# Altium project Stepper-Driver-v2.0.PrjPcb (part 3 of 5)

## Sheet Stepper-Driver-Sheet.SchDoc
size 420 x 297 mm; SheetNumber: 7; SheetTotal: 7
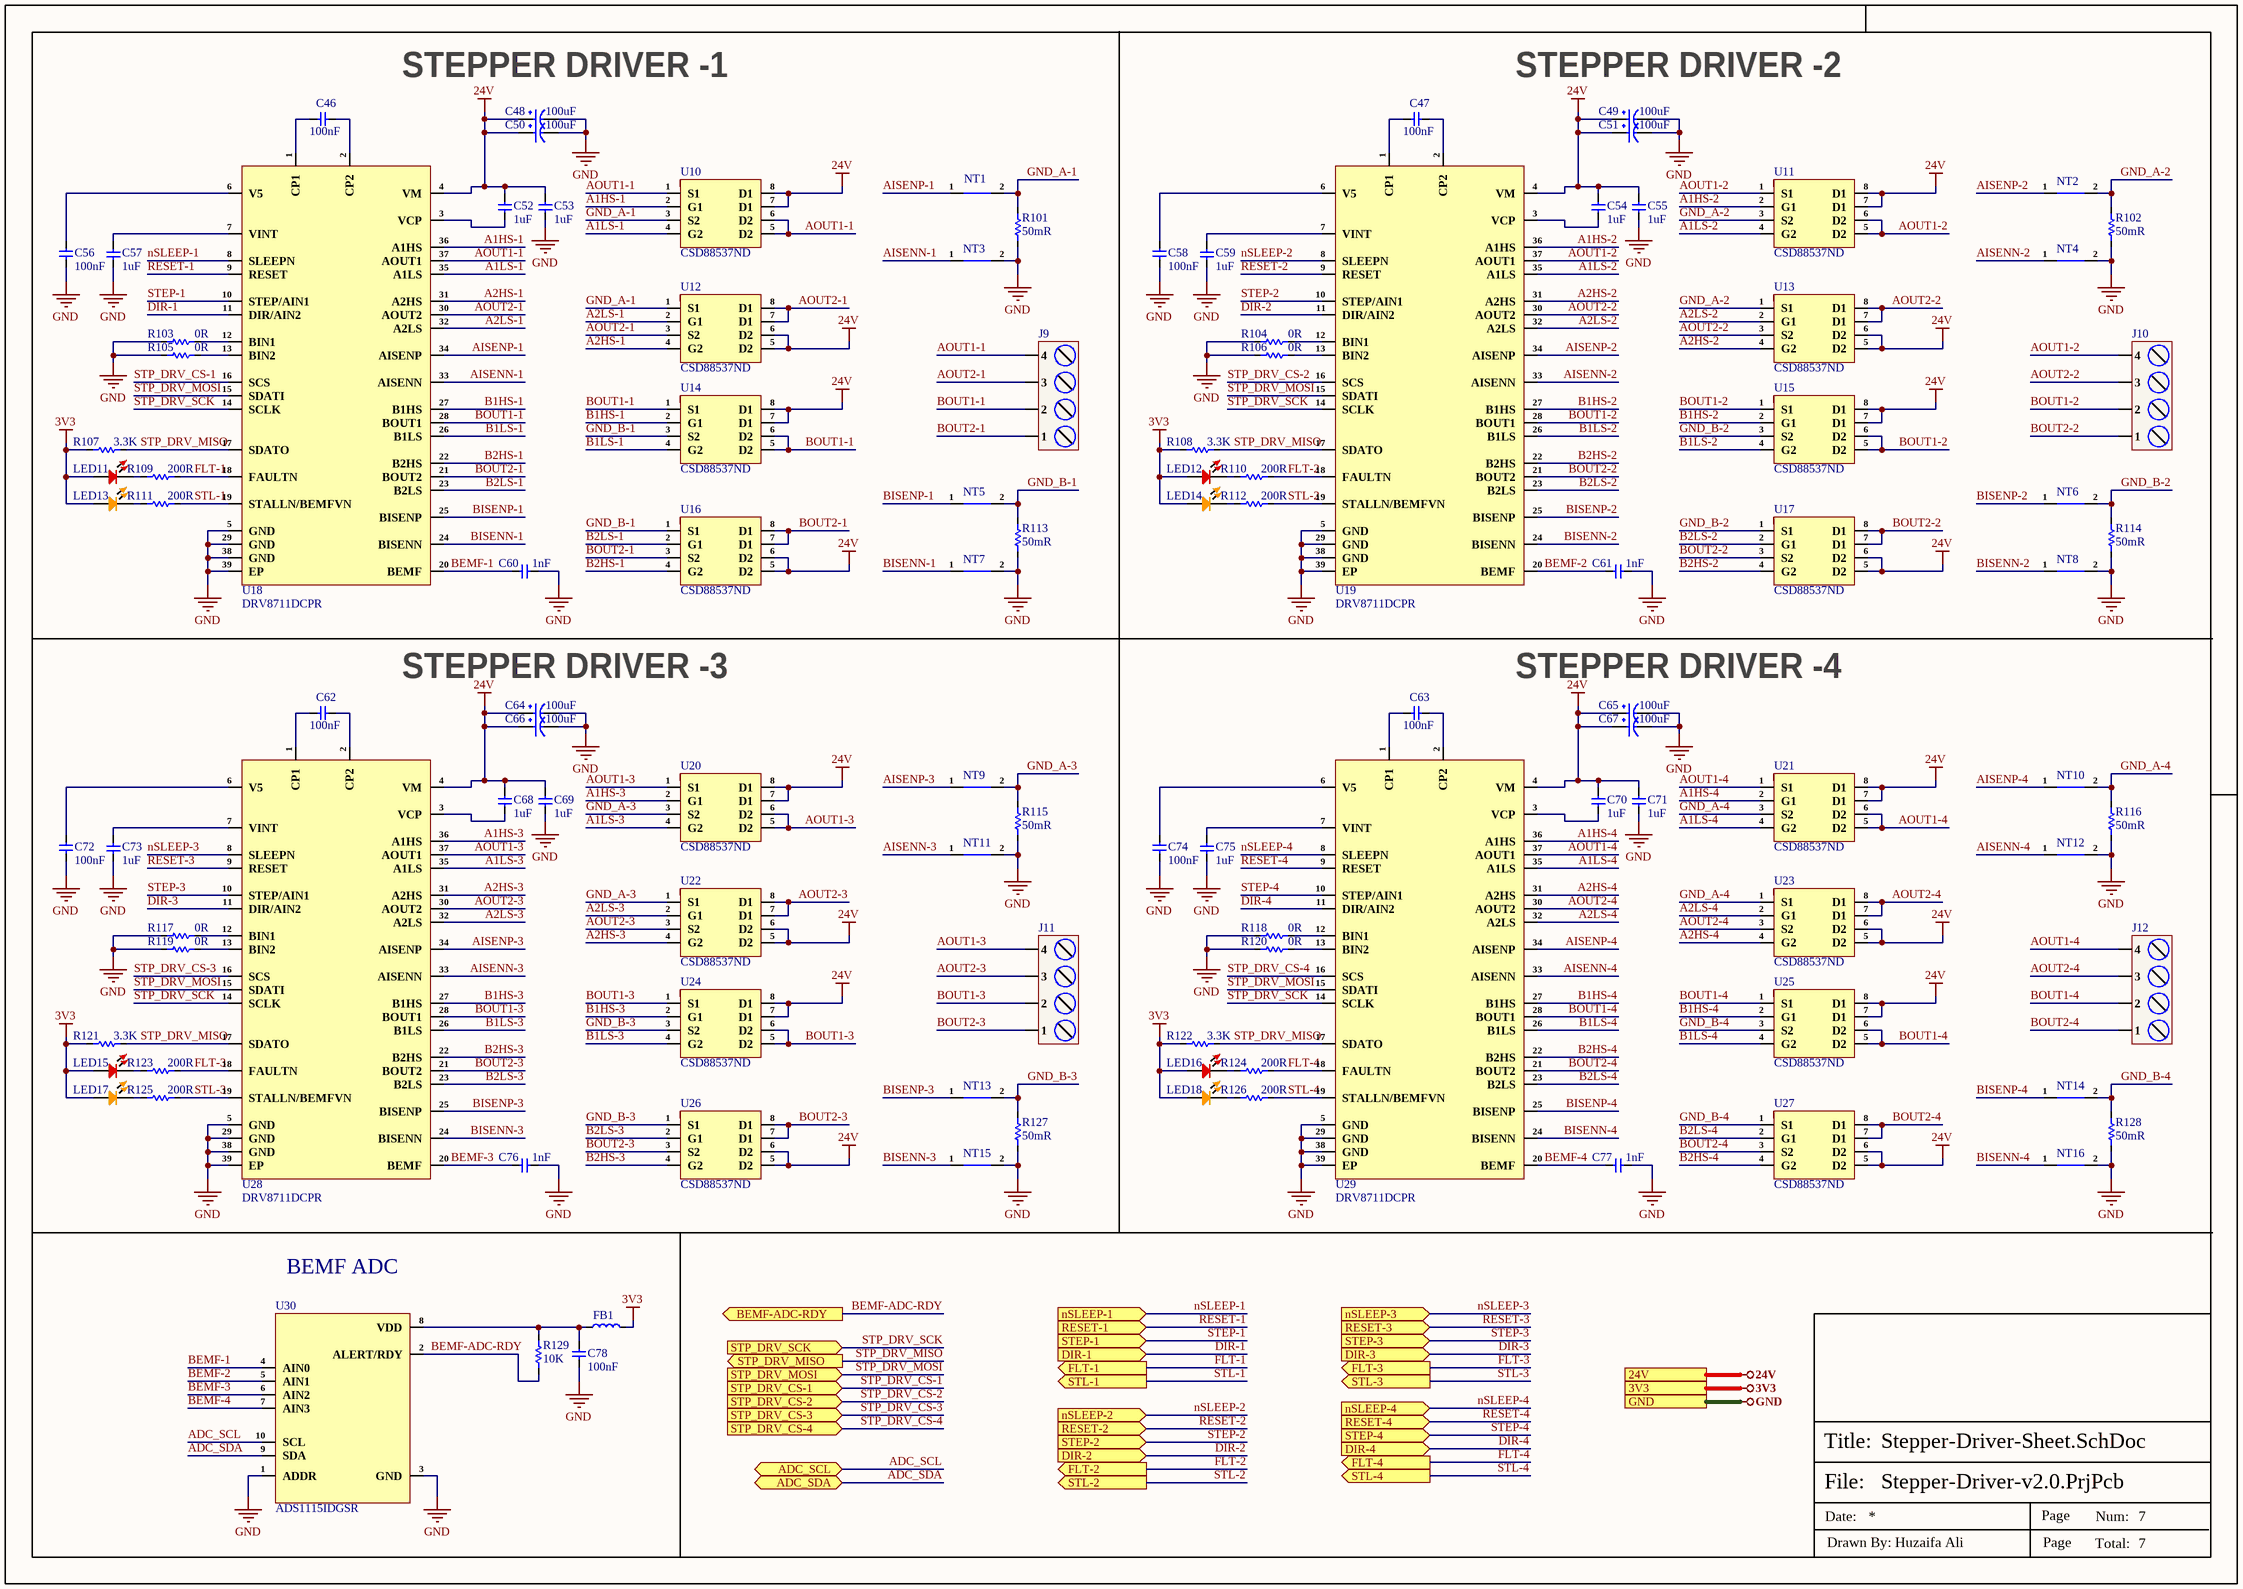
[diagram p4: Stepper-Driver-Sheet.SchDoc]

### Parts
C46  100nF  [cap-0402]
C47  100nF  [cap-0402]
C48  100uF  [SVZ1VM101E09E00RAXXX]
C49  100uF  [SVZ1VM101E09E00RAXXX]
C50  100uF  [SVZ1VM101E09E00RAXXX]
C51  100uF  [SVZ1VM101E09E00RAXXX]
C52  1uF  [Cap-0603]
C53  1uF  [Cap-0603]
C54  1uF  [Cap-0603]
C55  1uF  [Cap-0603]
C56  100nF  [cap-0402]
C57  1uF  [Cap-0603]
C58  100nF  [cap-0402]
C59  1uF  [Cap-0603]
C60  1nF  [Cap-0402]
C61  1nF  [Cap-0402]
C62  100nF  [cap-0402]
C63  100nF  [cap-0402]
C64  100uF  [SVZ1VM101E09E00RAXXX]
C65  100uF  [SVZ1VM101E09E00RAXXX]
C66  100uF  [SVZ1VM101E09E00RAXXX]
C67  100uF  [SVZ1VM101E09E00RAXXX]
C68  1uF  [Cap-0603]
C69  1uF  [Cap-0603]
C70  1uF  [Cap-0603]
C71  1uF  [Cap-0603]
C72  100nF  [cap-0402]
C73  1uF  [Cap-0603]
C74  100nF  [cap-0402]
C75  1uF  [Cap-0603]
C76  1nF  [Cap-0402]
C77  1nF  [Cap-0402]
C78  100nF  [cap-0402]
FB1  BLM18PG221SN1D  [IND-0603 (1608 Metric)]  (value not drawn)
J9  DB128L-5.08-4P-GN-S  [DB128L-5.08-4P-GN-S]  (value not drawn)
J10  DB128L-5.08-4P-GN-S  [DB128L-5.08-4P-GN-S]  (value not drawn)
J11  DB128L-5.08-4P-GN-S  [DB128L-5.08-4P-GN-S]  (value not drawn)
J12  DB128L-5.08-4P-GN-S  [DB128L-5.08-4P-GN-S]  (value not drawn)
LED11  RED  [LED-0603]  (value not drawn)
LED12  RED  [LED-0603]  (value not drawn)
LED13  NCD0603O2  [LED-0603]  (value not drawn)
LED14  NCD0603O2  [LED-0603]  (value not drawn)
LED15  RED  [LED-0603]  (value not drawn)
LED16  RED  [LED-0603]  (value not drawn)
LED17  NCD0603O2  [LED-0603]  (value not drawn)
LED18  NCD0603O2  [LED-0603]  (value not drawn)
NT1  Net Tie_SMD  [Net Tie Pad]  (value not drawn)  (net tie, no BOM)
NT2  Net Tie_SMD  [Net Tie Pad]  (value not drawn)  (net tie, no BOM)
NT3  Net Tie_SMD  [Net Tie Pad]  (value not drawn)  (net tie, no BOM)
NT4  Net Tie_SMD  [Net Tie Pad]  (value not drawn)  (net tie, no BOM)
NT5  Net Tie_SMD  [Net Tie Pad]  (value not drawn)  (net tie, no BOM)
NT6  Net Tie_SMD  [Net Tie Pad]  (value not drawn)  (net tie, no BOM)
NT7  Net Tie_SMD  [Net Tie Pad]  (value not drawn)  (net tie, no BOM)
NT8  Net Tie_SMD  [Net Tie Pad]  (value not drawn)  (net tie, no BOM)
NT9  Net Tie_SMD  [Net Tie Pad]  (value not drawn)  (net tie, no BOM)
NT10  Net Tie_SMD  [Net Tie Pad]  (value not drawn)  (net tie, no BOM)
NT11  Net Tie_SMD  [Net Tie Pad]  (value not drawn)  (net tie, no BOM)
NT12  Net Tie_SMD  [Net Tie Pad]  (value not drawn)  (net tie, no BOM)
NT13  Net Tie_SMD  [Net Tie Pad]  (value not drawn)  (net tie, no BOM)
NT14  Net Tie_SMD  [Net Tie Pad]  (value not drawn)  (net tie, no BOM)
NT15  Net Tie_SMD  [Net Tie Pad]  (value not drawn)  (net tie, no BOM)
NT16  Net Tie_SMD  [Net Tie Pad]  (value not drawn)  (net tie, no BOM)
R101  50mR  [RES-2010]
R102  50mR  [RES-2010]
R103  0R  [Res-0402]
R104  0R  [Res-0402]
R105  0R  [Res-0402]
R106  0R  [Res-0402]
R107  3.3K  [Res-0402]
R108  3.3K  [Res-0402]
R109  200R  [Res-0402]
R110  200R  [Res-0402]
R111  200R  [Res-0402]
R112  200R  [Res-0402]
R113  50mR  [RES-2010]
R114  50mR  [RES-2010]
R115  50mR  [RES-2010]
R116  50mR  [RES-2010]
R117  0R  [Res-0402]
R118  0R  [Res-0402]
R119  0R  [Res-0402]
R120  0R  [Res-0402]
R121  3.3K  [Res-0402]
R122  3.3K  [Res-0402]
R123  200R  [Res-0402]
R124  200R  [Res-0402]
R125  200R  [Res-0402]
R126  200R  [Res-0402]
R127  50mR  [RES-2010]
R128  50mR  [RES-2010]
R129  10K  [Res-0402]
U10  CSD88537ND  [SOIC-8]
U11  CSD88537ND  [SOIC-8]
U12  CSD88537ND  [SOIC-8]
U13  CSD88537ND  [SOIC-8]
U14  CSD88537ND  [SOIC-8]
U15  CSD88537ND  [SOIC-8]
U16  CSD88537ND  [SOIC-8]
U17  CSD88537ND  [SOIC-8]
U18  DRV8711DCPR  [HTSSOP-38-EP-4.4mm]
U19  DRV8711DCPR  [HTSSOP-38-EP-4.4mm]
U20  CSD88537ND  [SOIC-8]
U21  CSD88537ND  [SOIC-8]
U22  CSD88537ND  [SOIC-8]
U23  CSD88537ND  [SOIC-8]
U24  CSD88537ND  [SOIC-8]
U25  CSD88537ND  [SOIC-8]
U26  CSD88537ND  [SOIC-8]
U27  CSD88537ND  [SOIC-8]
U28  DRV8711DCPR  [HTSSOP-38-EP-4.4mm]
U29  DRV8711DCPR  [HTSSOP-38-EP-4.4mm]
U30  ADS1115IDGSR  [VSSOP-10]

### Ports
3V3 (see Top-Sheet[2B], Comms-Sheet[4D], Controller-Sheet-1[4D], Controller-Sheet-2[4D], Power-Sheet[4D], USB-Sheet[4D]), 24V (see Top-Sheet[2B], Power-Sheet[4D]), ADC_SCL (bidir, see Top-Sheet[2B]), ADC_SDA (bidir, see Top-Sheet[2B]), BEMF-ADC-RDY (out, see Top-Sheet[2B]), DIR-1 (in, see Top-Sheet[2C]), DIR-2 (in, see Top-Sheet[2C]), DIR-3 (in, see Top-Sheet[2C]), DIR-4 (in, see Top-Sheet[2C]), FLT-1 (out, see Top-Sheet[2B]), FLT-2 (out, see Top-Sheet[2B]), FLT-3 (out, see Top-Sheet[2B]), FLT-4 (out, see Top-Sheet[2B]), GND (see Top-Sheet[2B], Comms-Sheet[4D], Controller-Sheet-1[4D], Controller-Sheet-2[4D], Power-Sheet[4D], USB-Sheet[4D]), nSLEEP-1 (in, see Top-Sheet[2C]), nSLEEP-2 (in, see Top-Sheet[2C]), nSLEEP-3 (in, see Top-Sheet[2C]), nSLEEP-4 (in, see Top-Sheet[2C]), RESET-1 (in, see Top-Sheet[2C]), RESET-2 (in, see Top-Sheet[2C]), RESET-3 (in, see Top-Sheet[2C]), RESET-4 (in, see Top-Sheet[2C]), STEP-1 (in, see Top-Sheet[2B]), STEP-2 (in, see Top-Sheet[2B]), STEP-3 (in, see Top-Sheet[2C]), STEP-4 (in, see Top-Sheet[2C]), STL-1 (out, see Top-Sheet[2B]), STL-2 (out, see Top-Sheet[2B]), STL-3 (out, see Top-Sheet[2B]), STL-4 (out, see Top-Sheet[2B]), STP_DRV_CS-1 (in, see Top-Sheet[2B]), STP_DRV_CS-2 (in, see Top-Sheet[2B]), STP_DRV_CS-3 (in, see Top-Sheet[2B]), STP_DRV_CS-4 (in, see Top-Sheet[2B]), STP_DRV_MISO (out, see Top-Sheet[2B]), STP_DRV_MOSI (in, see Top-Sheet[2B]), STP_DRV_SCK (in, see Top-Sheet[2B])

### Nets
3V3: FB1.2 LED11.1 LED12.1 LED13.1 LED14.1 LED15.1 LED16.1 LED17.1 LED18.1 R107.1 R108.1 R121.1 R122.1 ; port 3V3
24V: C48.1 C49.1 C50.1 C51.1 C52.2 C53.2 C54.2 C55.2 C64.1 C65.1 C66.1 C67.1 C68.2 C69.2 C70.2 C71.2 U10.7(D1) U10.8(D1) U11.7(D1) U11.8(D1) U12.5(D2) U12.6(D2) U13.5(D2) U13.6(D2) U14.7(D1) U14.8(D1) U15.7(D1) U15.8(D1) U16.5(D2) U16.6(D2) U17.5(D2) U17.6(D2) U18.4(VM) U19.4(VM) U20.7(D1) U20.8(D1) U21.7(D1) U21.8(D1) U22.5(D2) U22.6(D2) U23.5(D2) U23.6(D2) U24.7(D1) U24.8(D1) U25.7(D1) U25.8(D1) U26.5(D2) U26.6(D2) U27.5(D2) U27.6(D2) U28.4(VM) U29.4(VM) ; port 24V
GND: C48.2 C49.2 C50.2 C51.2 C53.1 C55.1 C56.2 C57.1 C58.2 C59.1 C60.2 C61.2 C64.2 C65.2 C66.2 C67.2 C69.1 C71.1 C72.2 C73.1 C74.2 C75.1 C76.2 C77.2 C78.2 NT3.2 NT4.2 NT7.2 NT8.2 NT11.2 NT12.2 NT15.2 NT16.2 R101.1 R102.1 R103.1 R104.1 R105.1 R106.1 R113.1 R114.1 R115.1 R116.1 R117.1 R118.1 R119.1 R120.1 R127.1 R128.1 U18.5(GND) U18.29(GND) U18.38(GND) U18.39(EP) U19.5(GND) U19.29(GND) U19.38(GND) U19.39(EP) U28.5(GND) U28.29(GND) U28.38(GND) U28.39(EP) U29.5(GND) U29.29(GND) U29.38(GND) U29.39(EP) U30.1(ADDR) U30.3(GND) ; port GND
A1HS-1: U10.2(G1) U18.36(A1HS)
A1HS-2: U11.2(G1) U19.36(A1HS)
A1HS-3: U20.2(G1) U28.36(A1HS)
A1HS-4: U21.2(G1) U29.36(A1HS)
A1LS-1: U10.4(G2) U18.35(A1LS)
A1LS-2: U11.4(G2) U19.35(A1LS)
A1LS-3: U20.4(G2) U28.35(A1LS)
A1LS-4: U21.4(G2) U29.35(A1LS)
A2HS-1: U12.4(G2) U18.31(A2HS)
A2HS-2: U13.4(G2) U19.31(A2HS)
A2HS-3: U22.4(G2) U28.31(A2HS)
A2HS-4: U23.4(G2) U29.31(A2HS)
A2LS-1: U12.2(G1) U18.32(A2LS)
A2LS-2: U13.2(G1) U19.32(A2LS)
A2LS-3: U22.2(G1) U28.32(A2LS)
A2LS-4: U23.2(G1) U29.32(A2LS)
ADC_SCL: U30.10(SCL) ; port ADC_SCL
ADC_SDA: U30.9(SDA) ; port ADC_SDA
AISENN-1: NT3.1 U18.33(AISENN)
AISENN-2: NT4.1 U19.33(AISENN)
AISENN-3: NT11.1 U28.33(AISENN)
AISENN-4: NT12.1 U29.33(AISENN)
AISENP-1: NT1.1 U18.34(AISENP)
AISENP-2: NT2.1 U19.34(AISENP)
AISENP-3: NT9.1 U28.34(AISENP)
AISENP-4: NT10.1 U29.34(AISENP)
AOUT1-1: J9.4 U10.1(S1) U10.5(D2) U10.6(D2) U18.37(AOUT1)
AOUT1-2: J10.4 U11.1(S1) U11.5(D2) U11.6(D2) U19.37(AOUT1)
AOUT1-3: J11.4 U20.1(S1) U20.5(D2) U20.6(D2) U28.37(AOUT1)
AOUT1-4: J12.4 U21.1(S1) U21.5(D2) U21.6(D2) U29.37(AOUT1)
AOUT2-1: J9.3 U12.3(S2) U12.7(D1) U12.8(D1) U18.30(AOUT2)
AOUT2-2: J10.3 U13.3(S2) U13.7(D1) U13.8(D1) U19.30(AOUT2)
AOUT2-3: J11.3 U22.3(S2) U22.7(D1) U22.8(D1) U28.30(AOUT2)
AOUT2-4: J12.3 U23.3(S2) U23.7(D1) U23.8(D1) U29.30(AOUT2)
B1HS-1: U14.2(G1) U18.27(B1HS)
B1HS-2: U15.2(G1) U19.27(B1HS)
B1HS-3: U24.2(G1) U28.27(B1HS)
B1HS-4: U25.2(G1) U29.27(B1HS)
B1LS-1: U14.4(G2) U18.26(B1LS)
B1LS-2: U15.4(G2) U19.26(B1LS)
B1LS-3: U24.4(G2) U28.26(B1LS)
B1LS-4: U25.4(G2) U29.26(B1LS)
B2HS-1: U16.4(G2) U18.22(B2HS)
B2HS-2: U17.4(G2) U19.22(B2HS)
B2HS-3: U26.4(G2) U28.22(B2HS)
B2HS-4: U27.4(G2) U29.22(B2HS)
B2LS-1: U16.2(G1) U18.23(B2LS)
B2LS-2: U17.2(G1) U19.23(B2LS)
B2LS-3: U26.2(G1) U28.23(B2LS)
B2LS-4: U27.2(G1) U29.23(B2LS)
BEMF-1: C60.1 U18.20(BEMF) U30.4(AIN0)
BEMF-2: C61.1 U19.20(BEMF) U30.5(AIN1)
BEMF-3: C76.1 U28.20(BEMF) U30.6(AIN2)
BEMF-4: C77.1 U29.20(BEMF) U30.7(AIN3)
BEMF-ADC-RDY: R129.2 U30.2(ALERT/RDY) ; port BEMF-ADC-RDY
BISENN-1: NT7.1 U18.24(BISENN)
BISENN-2: NT8.1 U19.24(BISENN)
BISENN-3: NT15.1 U28.24(BISENN)
BISENN-4: NT16.1 U29.24(BISENN)
BISENP-1: NT5.1 U18.25(BISENP)
BISENP-2: NT6.1 U19.25(BISENP)
BISENP-3: NT13.1 U28.25(BISENP)
BISENP-4: NT14.1 U29.25(BISENP)
BOUT1-1: J9.2 U14.1(S1) U14.5(D2) U14.6(D2) U18.28(BOUT1)
BOUT1-2: J10.2 U15.1(S1) U15.5(D2) U15.6(D2) U19.28(BOUT1)
BOUT1-3: J11.2 U24.1(S1) U24.5(D2) U24.6(D2) U28.28(BOUT1)
BOUT1-4: J12.2 U25.1(S1) U25.5(D2) U25.6(D2) U29.28(BOUT1)
BOUT2-1: J9.1 U16.3(S2) U16.7(D1) U16.8(D1) U18.21(BOUT2)
BOUT2-2: J10.1 U17.3(S2) U17.7(D1) U17.8(D1) U19.21(BOUT2)
BOUT2-3: J11.1 U26.3(S2) U26.7(D1) U26.8(D1) U28.21(BOUT2)
BOUT2-4: J12.1 U27.3(S2) U27.7(D1) U27.8(D1) U29.21(BOUT2)
DIR-1: U18.11(DIR/AIN2) ; port DIR-1
DIR-2: U19.11(DIR/AIN2) ; port DIR-2
DIR-3: U28.11(DIR/AIN2) ; port DIR-3
DIR-4: U29.11(DIR/AIN2) ; port DIR-4
FLT-1: R109.2 U18.18(FAULTN) ; port FLT-1  [project net DI_PA3]
FLT-2: R110.2 U19.18(FAULTN) ; port FLT-2  [project net DI_PA5]
FLT-3: R123.2 U28.18(FAULTN) ; port FLT-3  [project net DI_PA7]
FLT-4: R124.2 U29.18(FAULTN) ; port FLT-4  [project net DI_PB10]
GND_A-1: NT1.2 R101.2 U10.3(S2) U12.1(S1)
GND_A-2: NT2.2 R102.2 U11.3(S2) U13.1(S1)
GND_A-3: NT9.2 R115.2 U20.3(S2) U22.1(S1)
GND_A-4: NT10.2 R116.2 U21.3(S2) U23.1(S1)
GND_B-1: NT5.2 R113.2 U14.3(S2) U16.1(S1)
GND_B-2: NT6.2 R114.2 U15.3(S2) U17.1(S1)
GND_B-3: NT13.2 R127.2 U24.3(S2) U26.1(S1)
GND_B-4: NT14.2 R128.2 U25.3(S2) U27.1(S1)
nSLEEP-1: U18.8(SLEEPN) ; port nSLEEP-1  [project net EXP_DO_PA0]
nSLEEP-2: U19.8(SLEEPN) ; port nSLEEP-2  [project net EXP_DO_PA2]
nSLEEP-3: U28.8(SLEEPN) ; port nSLEEP-3  [project net EXP_DO_PA4]
nSLEEP-4: U29.8(SLEEPN) ; port nSLEEP-4  [project net EXP_DO_PA6]
RESET-1: U18.9(RESET) ; port RESET-1  [project net EXP_DO_PA1]
RESET-2: U19.9(RESET) ; port RESET-2  [project net EXP_DO_PA3]
RESET-3: U28.9(RESET) ; port RESET-3  [project net EXP_DO_PA5]
RESET-4: U29.9(RESET) ; port RESET-4  [project net EXP_DO_PA7]
STEP-1: U18.10(STEP/AIN1) ; port STEP-1
STEP-2: U19.10(STEP/AIN1) ; port STEP-2
STEP-3: U28.10(STEP/AIN1) ; port STEP-3
STEP-4: U29.10(STEP/AIN1) ; port STEP-4  [project net LPTIM1_CH1_PC12]
STL-1: R111.2 U18.19(STALLN/BEMFVN) ; port STL-1  [project net DI_PA4]
STL-2: R112.2 U19.19(STALLN/BEMFVN) ; port STL-2  [project net DI_PA6]
STL-3: R125.2 U28.19(STALLN/BEMFVN) ; port STL-3  [project net DI_PA8]
STL-4: R126.2 U29.19(STALLN/BEMFVN) ; port STL-4  [project net DI_PB14]
STP_DRV_CS-1: U18.16(SCS) ; port STP_DRV_CS-1  [project net SPI1_NSS]
STP_DRV_CS-2: U19.16(SCS) ; port STP_DRV_CS-2  [project net DO_PC10]
STP_DRV_CS-3: U28.16(SCS) ; port STP_DRV_CS-3  [project net DO_PC11]
STP_DRV_CS-4: U29.16(SCS) ; port STP_DRV_CS-4  [project net DO_PC13]
STP_DRV_MISO: R107.2 R108.2 R121.2 R122.2 U18.17(SDATO) U19.17(SDATO) U28.17(SDATO) U29.17(SDATO) ; port STP_DRV_MISO  [project net SPI1_MISO]
STP_DRV_MOSI: U18.15(SDATI) U19.15(SDATI) U28.15(SDATI) U29.15(SDATI) ; port STP_DRV_MOSI  [project net SPI1_MOSI]
STP_DRV_SCK: U18.14(SCLK) U19.14(SCLK) U28.14(SCLK) U29.14(SCLK) ; port STP_DRV_SCK  [project net SPI1_SCK]
NetC46_1: C46.1 U18.2(CP2)
NetC46_2: C46.2 U18.1(CP1)
NetC47_1: C47.1 U19.2(CP2)
NetC47_2: C47.2 U19.1(CP1)
NetC52_1: C52.1 U18.3(VCP)
NetC54_1: C54.1 U19.3(VCP)
NetC56_1: C56.1 U18.6(V5)
NetC57_2: C57.2 U18.7(VINT)
NetC58_1: C58.1 U19.6(V5)
NetC59_2: C59.2 U19.7(VINT)
NetC62_1: C62.1 U28.2(CP2)
NetC62_2: C62.2 U28.1(CP1)
NetC63_1: C63.1 U29.2(CP2)
NetC63_2: C63.2 U29.1(CP1)
NetC68_1: C68.1 U28.3(VCP)
NetC70_1: C70.1 U29.3(VCP)
NetC72_1: C72.1 U28.6(V5)
NetC73_2: C73.2 U28.7(VINT)
NetC74_1: C74.1 U29.6(V5)
NetC75_2: C75.2 U29.7(VINT)
NetC78_1: C78.1 FB1.1 R129.1 U30.8(VDD)
NetLED11_2: LED11.2 R109.1
NetLED12_2: LED12.2 R110.1
NetLED13_2: LED13.2 R111.1
NetLED14_2: LED14.2 R112.1
NetLED15_2: LED15.2 R123.1
NetLED16_2: LED16.2 R124.1
NetLED17_2: LED17.2 R125.1
NetLED18_2: LED18.2 R126.1
NetR103_2: R103.2 U18.12(BIN1)
NetR104_2: R104.2 U19.12(BIN1)
NetR105_2: R105.2 U18.13(BIN2)
NetR106_2: R106.2 U19.13(BIN2)
NetR117_2: R117.2 U28.12(BIN1)
NetR118_2: R118.2 U29.12(BIN1)
NetR119_2: R119.2 U28.13(BIN2)
NetR120_2: R120.2 U29.13(BIN2)

### Notes on the sheet
- STEPPER DRIVER -1
- STEPPER DRIVER -2
- STEPPER DRIVER -3
- STEPPER DRIVER -4
- (near U30) BEMF ADC
- File:
- Title:
- Date:
- Page
- Num:
- Total:
- Drawn By: Huzaifa Ali

### Library data of the parts
C46 C47 C56 C58 C62 C63 C72 C74 C78 = C1005X7R1H104KT000F: CAP CER 0.1UF 50V X7R 0402; Manufacturer: TDK; Tolerance: 10%; Voltage: 25V; Item Type: Capacitor; Supplier 1: Avnet; Manufacturer Part Number: C1005X7R1H104KT000F; RoHS: No; Category: Ceramic Capacitors; Dielectric: X7R; Supplier Part Number 1: C1005X7R1H104KT000F; LCSC Part Number: C361198; ComponentLink1Description: LCSC; ComponentLink1URL: https://www.lcsc.com/product-detail/Multilayer-Ceramic-Capacitors-MLCC-SMD-SMT_TDK-C1005X7R1H104KT000F_C361198.html
C48-C51 C64-C67 = SVZ1VM101E09E00RAXXX: 35V 100uF Polymer ±20% SMD,D6.3xL9mm Polymer Aluminum Capacitors ROHS; Manufacturer: KNSCHA; Manufacturer Part Number: SVZ1VM101E09E00RAXXX; Package: SMD,D6.3xL9mm; LCSC Part Number: C2939795; Item Type: Capacitor; ComponentLink1Description: LCSC; ComponentLink1URL: https://www.lcsc.com/product-detail/Polymer-Aluminum-Capacitors_AISHI-Aihua-Group-SVZ1VM101E09E00RAXXX_C2939795.html
C52-C55 C57 C59 C68-C71 C73 C75 = CL10A105KB8NNNC: CAP CER 1UF 50V X5R 0603; Manufacturer: Samsung; Material: 4241ConductorMaterial; Tolerance: 10%; Item Type: Capacitor; Supplier: Avnet; Supplier Part Number: CL10A105KB8NNNC; Manufacturer Part Number: CL10A105KB8NNNC; RoHS: Yes; Category: Ceramic Capacitors; Stock: 780446; Pricing: 4000=0.01632, 8000=0.01595, 16000=0.01557, 24000=0.0152, 32000=0.01482 (USD); Mounting Technology: Surface Mount; Case/Package: 0603; Case Code (Metric): 1608; Case Code (Imperial): 0603; Min Operating Temperature: -55°C; Max Operating Temperature: 85°C; Packaging: Tape and Reel; Value: 1uF; Voltage Rating: 50V; Dielectric: X5R; Series: CL; Voltage Rating (DC): 50V; Length: 1.6mm; Depth: 0.8mm; Radiation Hardening: No; RoHS Compliant: Yes; ComponentLink1URL: https://datasheet.ciiva.com/26877/getdatasheetpartid-753736-26877879.pdf?src-supplier=Verical; ComponentLink1Description: https://datasheet.ciiva.com/26877/getdatasheetpartid-753736-26877879.pdf?src-supplier=Verical; LCSC Part Number: C15849
C60 C61 C76 C77 = C1005C0G1E102JT000F: CAP CER 1000PF 25V C0G 0402; Manufacturer: TDK; Item Type: Capacitor; ComponentLink1Description: LCSC; ComponentLink1URL: https://www.lcsc.com/product-detail/Multilayer-Ceramic-Capacitors-MLCC-SMD-SMT_TDK-C1005C0G1E102JT000F_C343059.html; Manufacturer Part Number: C1005C0G1E102JT000F; Package: 0402; LCSC Part Number: C343059
FB1 = BLM18PG221SN1D: FERRITE BEAD 220 OHM 0603 1LN; Manufacturer: Murata; Manufacturer Series: BLM18P; Material: Steel,Ferrite; Value: 100mR; Impedance: 220R; Tolerance: 25%; Current Rating: 1.4A; Number of Lines: 1; Test Frequency: 100MHz; Shielding: Unshielded; Supplier: Digikey; LCSC Part Number: C80165; Manufacturer Part Number: BLM18PG221SN1D; RoHS: Yes; Item Type: Ferrite Bead; Stock: 134052; Pricing: 1=0.1, 10=0.078, 25=0.0712, 50=0.064, 100=0.0469, 250=0.03412, 500=0.03128, 1000=0.02701 (USD); Case/Package: 0603; Pins: 2; Core Material: Ferrite; Case Code (Metric): 1608; Case Code (Imperial): 0603; Weight: 7.1E-05oz; Min Operating Temperature: -55°C; Max Operating Temperature: 125°C; Package Quantity: 1; Packaging: Tape and Reel; ESR (Equivalent Series Resistance): 220R; Max Current Rating: 1.4A; DC Resistance (DCR): 100mR; Termination: SMD/SMT; Max DC Current: 1.4A; DC Current: 1.4A; Number of Circuits: 1; Series: BLM18P; Channels: 1; DC Resistance-Max: 100mR; RMS Current (Irms): 1.4A; ESR: 100mR; Length: 1.6mm; Width: 0.8mm; Height: 0.8mm; Depth: 0.8mm; Radiation Hardening: No; Reach SVHC Compliant: No; Lead Free: Lead Free; RoHS Compliant: Yes; ComponentLink1URL: https://datasheet.ciiva.com/19458/1845030-19458417.pdf?src-supplier=Jameco; ComponentLink1Description: https://datasheet.ciiva.com/19458/1845030-19458417.pdf?src-supplier=Jameco; ComponentLink2URL: https://datasheet.ciiva.com/11800/0900766b81275ca5-11800851.pdf?src-supplier=Rs; ComponentLink2Description: https://datasheet.ciiva.com/11800/0900766b81275ca5-11800851.pdf?src-supplier=Rs; ComponentLink3URL: https://datasheet.ciiva.com/29347/442391-da-01-en-chip-drossel-0603-220r-1400ma-1-6x0-8mm-29347986.pdf?src-supplier=Conrad; ComponentLink3Description: https://datasheet.ciiva.com/29347/442391-da-01-en-chip-drossel-0603-220r-1400ma-1-6x0-8mm-29347986.pdf?src-supplier=Conrad; ComponentLink4URL: https://datasheet.ciiva.com/8021/5148-8021482.pdf?src-supplier=Element14; ComponentLink4Description: https://datasheet.ciiva.com/8021/5148-8021482.pdf?src-supplier=Element14; ComponentLink5URL: https://datasheet.ciiva.com/8021/5148-8021479.pdf?src-supplier=Element14; ComponentLink5Description: https://datasheet.ciiva.com/8021/5148-8021479.pdf?src-supplier=Element14; ComponentLink6URL: https://datasheet.ciiva.com/14122/blm-series-eng-tds-14122909.pdf?src-supplier=Distrelec; ComponentLink6Description: https://datasheet.ciiva.com/14122/blm-series-eng-tds-14122909.pdf?src-supplier=Distrelec; ComponentLink7URL: https://datasheet.ciiva.com/1012/l0110s0100blm18p-1012162.pdf?src-supplier=Digikey; ComponentLink7Description: https://datasheet.ciiva.com/1012/l0110s0100blm18p-1012162.pdf?src-supplier=Digikey; ComponentLink8URL: https://datasheet.ciiva.com/1012/l0110s0100blm18p-1012161.pdf?src-supplier=Digikey; ComponentLink8Description: https://datasheet.ciiva.com/1012/l0110s0100blm18p-1012161.pdf?src-supplier=Digikey; ComponentLink9URL: https://datasheet.ciiva.com/1012/l0110s0100blm18p-1012163.pdf?src-supplier=Digikey; ComponentLink9Description: https://datasheet.ciiva.com/1012/l0110s0100blm18p-1012163.pdf?src-supplier=Digikey; ComponentLink10URL: https://datasheet.ciiva.com/3081/l0110s0100blm18p-3081633.pdf?src-supplier=Avnet; ComponentLink10Description: https://datasheet.ciiva.com/3081/l0110s0100blm18p-3081633.pdf?src-supplier=Avnet; ComponentLink11URL: https://datasheet.ciiva.com/16205/l0110s0100blm18p-16205422.pdf?src-supplier=Future+Electronics; ComponentLink11Description: https://datasheet.ciiva.com/16205/l0110s0100blm18p-16205422.pdf?src-supplier=Future+Electronics
J9-J12 = DB128L-5.08-4P-GN-S: 1x4P 18A -40℃~+105℃ 250V Green 12~30 Direct Insert 5.08mm 2.5 1 4 Plugin,P=5.08mm Screw Terminal Blocks ROHS; Manufacturer: DORABO; Manufacturer Part Number: DB128L-5.08-4P-GN-S; Package: Plugin,P=5.08mm; LCSC Part Number: C2827883; Item Type: Terminal Block; ComponentLink1Description: LCSC; ComponentLink1URL: https://www.lcsc.com/product-detail/Screw-Terminal-Blocks_DORABO-DB128L-5-08-4P-GN-S_C2827883.html
LED11 LED12 LED15 LED16 = NCD0603R3: RED LED 0603 Light Emitting Diodes; Manufacturer: Foshan NationStar Optoelectronics; Manufacturer Part Number: NCD0603R3; Package: 0603; Item Type: LED; LCSC Part Number: C3151730; ComponentLink1Description: LCSC; ComponentLink1URL: https://www.lcsc.com/product-detail/Light-Emitting-Diodes-LED_Foshan-NationStar-Optoelectronics-NCD0603R3_C3151730.html
LED13 LED14 LED17 LED18 = NCD0603O2: 20mA 100mcd~220mcd 600nm~610nm -30℃~+85℃ Orange 130° 65mW 1.6V~2.6V 0603 Light Emitting Diodes (LED) ROHS; Manufacturer: FOSHAN Nationstar Optoelectronics; Supplier: LCSC; LCSC Part Number: C108553; Manufacturer Part Number: NCD0603O2; RoHS: No; Item Type: LED
NT1-NT16 = Net Tie_SMD: Net Tie SMD; Manufacturer Part Number: Net Tie; Item Type: Net Tie Pad
R101 R102 R113-R116 R127 R128 = RLM20FECR050: 1W 50mΩ Surface Mount Current Sensing Resistors ±50ppm/℃ ±1% 2010 Current Sense Resistors/Shunt Resistors ROHS; Manufacturer: TA-I Tech; Manufacturer Part Number: RLM20FECR050; Package: 2010; LCSC Part Number: C912938; Item Type: Shunt Resistor; ComponentLink1Description: LCSC; ComponentLink1URL: https://www.lcsc.com/product-detail/Current-Sense-Resistors-Shunt-Resistors_TA-I-Tech-RLM20FECR050_C912938.html
R103-R106 R117-R120 = RC0402FR-070RL: RES 0 OHM JUMPER 1/16W 0402; Manufacturer: Yageo; Item Type: Resistors; Tolerance: 1%; Power Rating: 62.5mW; Voltage Rating: 50V; Temperature Coefficient: 200ppm/°C; Max Power Dissipation: 63mW; Supplier 1: Mouser; Manufacturer Part Number: RC0402FR-070RL; RoHS: Yes; Stock 1: 8556842; Pricing 1: 1=0.10000, 10=0.01400, 50=0.01400, 100=0.00600, 1000=0.00300, 5000=0.00200, 10000=0.00100 (USD); Mount: Surface Mount; Case/Package: 0402; Contact Plating: Tin,Matte; Case Code (Imperial): 0402; Case Code (Metric): 1005; Size Code: 0402; Min Operating Temperature: -55°C; Max Operating Temperature: 155°C; Resistance: 0R; Resistor Type: Thick Film; Packaging: Tape and Reel; Termination: SMD/SMT; Features: Moisture Resistant; Series: RC; Number of Terminations: 2; Length: 1mm; Width: 0.5mm; Height: 0.35mm; Radiation Hardening: No; Lead Free: Lead Free; RoHS Compliant: Yes; ComponentLink1URL: https://datasheet.ciiva.com/8896/pyu-rc0402-51-rohs-l-6-8896149.pdf?src-supplier=Avnet; ComponentLink1Description: https://datasheet.ciiva.com/8896/pyu-rc0402-51-rohs-l-6-8896149.pdf?src-supplier=Avnet; ComponentLink2URL: https://datasheet.ciiva.com/16790/pyu-rc0402-51-rohs-l-6-r-16790444.pdf?src-supplier=Future+Electronics; ComponentLink2Description: https://datasheet.ciiva.com/16790/pyu-rc0402-51-rohs-l-6-r-16790444.pdf?src-supplier=Future+Electronics; Supplier Part Number 1: 603-RC0402FR-070RL; LCSC Part Number: C106231
R107 R108 R121 R122 = RC0402FR-073K3L: RES 3.3K OHM 1% 1/16W 0402; Manufacturer: Yageo; Resistance: 3.3kR; Power Rating: 62.5mW; Voltage Rating: 50V; Temperature Coefficient: 100ppm/°C; Max Power Dissipation: 63mW; Item Type: Resistor; Supplier 1: Mouser; Manufacturer Part Number: RC0402FR-073K3L; RoHS: Yes; Category: Chip SMD Resistors; Stock 1: 2413047; Pricing 1: 1=0.10000, 10=0.01400, 50=0.01400, 100=0.00600, 1000=0.00300, 5000=0.00200, 10000=0.00100 (USD); Case/Package: 0402; Number of Pins: 2; Case Code (Imperial): 0402; Case Code (Metric): 1005; Size Code: 0402; Min Operating Temperature: -55°C; Max Operating Temperature: 155°C; Tolerance: 1%; Voltage Rating (DC): 50V; Packaging: Tape and Reel; Package Quantity: 1; Termination: SMD/SMT; Resistor Type: Thick Film; Number of Terminations: 2; Features: Moisture Resistant; Series: RC; Resistance Tolerance: 1%; Technology: THICK FILM; Construction: Rectangular; Length: 1mm; Width: 0.5mm; Height: 0.016inch; Depth: 0.5mm; RoHS Compliant: Yes; REACH SVHC: No SVHC; Military Standard: Not; Lead Free: Lead Free; ComponentLink1URL: https://datasheet.ciiva.com/11808/0900766b80c66297-11808441.pdf?src-supplier=RSComponents; ComponentLink1Description: https://datasheet.ciiva.com/11808/0900766b80c66297-11808441.pdf?src-supplier=RSComponents; ComponentLink2URL: https://datasheet.ciiva.com/46394/1018594-46394940.pdf?src-supplier=Element14; ComponentLink2Description: https://datasheet.ciiva.com/46394/1018594-46394940.pdf?src-supplier=Element14; ComponentLink3URL: https://datasheet.ciiva.com/2453/pyu-r-int-thick-7-2453395.pdf?src-supplier=Digi-Key; ComponentLink3Description: https://datasheet.ciiva.com/2453/pyu-r-int-thick-7-2453395.pdf?src-supplier=Digi-Key; ComponentLink4URL: https://datasheet.ciiva.com/2453/pyu-r-int-thick-7-2453396.pdf?src-supplier=Digi-Key; ComponentLink4Description: https://datasheet.ciiva.com/2453/pyu-r-int-thick-7-2453396.pdf?src-supplier=Digi-Key; ComponentLink5URL: https://datasheet.ciiva.com/2453/pyu-r-int-thick-7-2453394.pdf?src-supplier=Digi-Key; ComponentLink5Description: https://datasheet.ciiva.com/2453/pyu-r-int-thick-7-2453394.pdf?src-supplier=Digi-Key; ComponentLink6URL: https://datasheet.ciiva.com/16746/pyu-rc0402-51-rohs-l-6-r-16746361.pdf?src-supplier=Future+Electronics; ComponentLink6Description: https://datasheet.ciiva.com/16746/pyu-rc0402-51-rohs-l-6-r-16746361.pdf?src-supplier=Future+Electronics; Supplier Part Number 1: 603-RC0402FR-073K3L; LCSC Part Number: C137992
R109-R112 R123-R126 = RC0402FR-07200RL: RES 200 OHM 1% 1/16W 0402; Manufacturer: Yageo; Temperature Coefficient: 100ppm/°C; Power Rating: 63mW; Voltage Rating (DC): 50V; Supplier 1: Digi-Key; Manufacturer Part Number: RC0402FR-07200RL; RoHS: Yes; Category: Chip SMD Resistors; Stock 1: 19778; Pricing 1: 1=0.10000, 10=0.01600, 100=0.00660, 1000=0.00299, 2500=0.00259, 5000=0.00214 (USD); Case/Package: 0402; Case Code (Metric): 1005; Case Code (Imperial): 0402; Size Code: 0402; Min Operating Temperature: -55°C; Max Operating Temperature: 155°C; Tolerance: 1%; Resistance: 200R; Resistor Type: Thick Film; Packaging: Tape and Reel; Voltage Rating: 50V; Package Quantity: 1; Number of Terminations: 2; Termination: SMD/SMT; Max Power Dissipation: 63mW; Features: Moisture Resistant; Series: RC; Construction: Rectangular; Resistance Tolerance: 1%; Length: 1mm; Width: 0.02inch; Height: 0.016inch; Depth: 0.5mm; REACH SVHC: No SVHC; Lead Free: Lead Free; RoHS Compliant: Yes; Military Standard: Not; ComponentLink1URL: https://datasheet.ciiva.com/2553/pyu-r-int-thick-7-2553232.pdf?src-supplier=Digi-Key; ComponentLink1Description: https://datasheet.ciiva.com/2553/pyu-r-int-thick-7-2553232.pdf?src-supplier=Digi-Key; ComponentLink2URL: https://datasheet.ciiva.com/7983/1018594-7983509.pdf?src-supplier=Element14; ComponentLink2Description: https://datasheet.ciiva.com/7983/1018594-7983509.pdf?src-supplier=Element14; ComponentLink3URL: https://datasheet.ciiva.com/16804/pyu-rc0402-51-rohs-l-6-r-16804406.pdf?src-supplier=Future+Electronics; ComponentLink3Description: https://datasheet.ciiva.com/16804/pyu-rc0402-51-rohs-l-6-r-16804406.pdf?src-supplier=Future+Electronics; ComponentLink4URL: https://datasheet.ciiva.com/15189/getdatasheetpartid-331152-15189383.pdf?src-supplier=Verical; ComponentLink4Description: https://datasheet.ciiva.com/15189/getdatasheetpartid-331152-15189383.pdf?src-supplier=Verical; ComponentLink5URL: https://datasheet.ciiva.com/7849/1018594-7849898.pdf?src-supplier=Element14; ComponentLink5Description: https://datasheet.ciiva.com/7849/1018594-7849898.pdf?src-supplier=Element14; ComponentLink6URL: https://datasheet.ciiva.com/5562/pyu-rc0402-51-rohs-l-6-r-8721-5562539.pdf?src-supplier=Mouser; ComponentLink6Description: https://datasheet.ciiva.com/5562/pyu-rc0402-51-rohs-l-6-r-8721-5562539.pdf?src-supplier=Mouser; ComponentLink7URL: https://datasheet.ciiva.com/7849/1018594-7849899.pdf?src-supplier=Element14; ComponentLink7Description: https://datasheet.ciiva.com/7849/1018594-7849899.pdf?src-supplier=Element14; ComponentLink8URL: https://datasheet.ciiva.com/2553/pyu-r-int-thick-7-2553230.pdf?src-supplier=Digi-Key; ComponentLink8Description: https://datasheet.ciiva.com/2553/pyu-r-int-thick-7-2553230.pdf?src-supplier=Digi-Key; ComponentLink9URL: https://datasheet.ciiva.com/2553/pyu-r-int-thick-7-2553231.pdf?src-supplier=Digi-Key; ComponentLink9Description: https://datasheet.ciiva.com/2553/pyu-r-int-thick-7-2553231.pdf?src-supplier=Digi-Key; Supplier Part Number 1: 311-200LRCT-ND; LCSC Part Number: C114764
R129 = RC0402FR-0710KL: RES 10K OHM 1% 1/16W 0402; Manufacturer: Yageo; Resistance: 10kR; Voltage Rating (DC): 50V; Temperature Coefficient: 100ppm/°C; Power Rating: 62.5mW; Max Power Dissipation: 63mW; Item Type: Resistor; Supplier 1: Mouser; Manufacturer Part Number: RC0402FR-0710KL; RoHS: Yes; Category: Chip SMD Resistors; Stock 1: 18648329; Pricing 1: 1=0.10000, 10=0.01400, 50=0.01400, 100=0.00500, 1000=0.00300, 10000=0.00200 (USD); Case/Package: 0402; Number of Pins: 2; Case Code (Imperial): 0402; Case Code (Metric): 1005; Min Operating Temperature: -55°C; Max Operating Temperature: 155°C; Resistor Type: Thick Film; Tolerance: 1%; Packaging: Tape and Reel; Voltage Rating: 50V; Termination: SMD/SMT; Working Voltage: 50V; Number of Terminations: 2; Features: Moisture Resistant; Series: RC; Resistance Tolerance: 1%; Construction: Rectangular; Length: 1mm; Width: 0.5mm; Height: 0.32mm; Depth: 0.5mm; Lead Pitch: 0.2mm; REACH SVHC: No SVHC; Lead Free: Lead Free; RoHS Compliant: Yes; Military Standard: Not; ComponentLink1URL: https://datasheet.ciiva.com/7660/38568-7660787.pdf?src-supplier=Element14; ComponentLink1Description: https://datasheet.ciiva.com/7660/38568-7660787.pdf?src-supplier=Element14; ComponentLink2URL: https://datasheet.ciiva.com/7849/1686128-7849814.pdf?src-supplier=Element14; ComponentLink2Description: https://datasheet.ciiva.com/7849/1686128-7849814.pdf?src-supplier=Element14; ComponentLink3URL: https://datasheet.ciiva.com/7983/1018594-7983486.pdf?src-supplier=Element14; ComponentLink3Description: https://datasheet.ciiva.com/7983/1018594-7983486.pdf?src-supplier=Element14; ComponentLink4URL: https://datasheet.ciiva.com/22747/1018594-22747512.pdf?src-supplier=Element14; ComponentLink4Description: https://datasheet.ciiva.com/22747/1018594-22747512.pdf?src-supplier=Element14; ComponentLink5URL: https://datasheet.ciiva.com/12667/pyu-rc0402-51-rohs-l-6-r-12667067.pdf?src-supplier=Mouser; ComponentLink5Description: https://datasheet.ciiva.com/12667/pyu-rc0402-51-rohs-l-6-r-12667067.pdf?src-supplier=Mouser; ComponentLink6URL: https://datasheet.ciiva.com/7849/1784430-7849813.pdf?src-supplier=Element14; ComponentLink6Description: https://datasheet.ciiva.com/7849/1784430-7849813.pdf?src-supplier=Element14; ComponentLink7URL: https://datasheet.ciiva.com/7849/1784430-7849815.pdf?src-supplier=Element14; ComponentLink7Description: https://datasheet.ciiva.com/7849/1784430-7849815.pdf?src-supplier=Element14; Supplier Part Number 1: 603-RC0402FR-0710KL; LCSC Part Number: C60490
U10-U17 U20-U27 = CSD88537ND: MOSFET 2N-CH 60V 15A 8SOIC; Manufacturer: Texas Instruments; Item Type: IC; Supplier: Mouser; LCSC Part Number: C117439; Manufacturer Part Number: CSD88537ND; RoHS: Yes; Stock: 24825; Pricing: 1=1.26, 10=1.03, 50=1.03, 100=0.8, 1000=0.552, 10000=0.494 (USD); ComponentLink1URL: https://datasheet.ciiva.com/29589/csd88537nd-29589985.pdf?src-supplier=Digikey; ComponentLink1Description: https://datasheet.ciiva.com/29589/csd88537nd-29589985.pdf?src-supplier=Digikey; ComponentLink2URL: https://datasheet.ciiva.com/46430/1857624-46430364.pdf?src-supplier=Element14; ComponentLink2Description: https://datasheet.ciiva.com/46430/1857624-46430364.pdf?src-supplier=Element14
U18 U19 U28 U29 = DRV8711DCPR: IC MTR DRV BIPOLR 8-52V 38HTSSOP; Manufacturer: Texas Instruments; Output Current: 200mA; Output Voltage: 5V; Min Supply Voltage: 8V; Max Supply Voltage: 52V; Interface: SPI; Supply Current: 17mA; Supplier: Mouser; LCSC Part Number: C60013; Manufacturer Part Number: DRV8711DCPR; RoHS: Yes; Item Type: IC; Stock: 9050; Pricing: 1=4.97, 10=4.29, 50=4.29, 100=3.66, 1000=2.63, 10000=2.48 (USD); Mounting Technology: Surface Mount; Case/Package: HTSSOP; Pins: 38; Min Operating Temperature: -40°C; Max Operating Temperature: 85°C; Packaging: Tape and Reel; Package Quantity: 2000; Series: -; Radiation Hardening: No; Lead Free: Lead Free; RoHS Compliant: Yes; ComponentLink1URL: https://datasheet.ciiva.com/24016/slvsc40d-317294-24016712.pdf?src-supplier=Mouser; ComponentLink1Description: https://datasheet.ciiva.com/24016/slvsc40d-317294-24016712.pdf?src-supplier=Mouser
U30 = ADS1115IDGSR: IC ADC 16BIT SIGMA-DELTA 10VSSOP; Manufacturer: Texas Instruments; Interface: I2C; Number of Bits: 16; Sampling Rate: 860S/s; Number of A/D Converters: 1; Resolution: 16b; Polarity: Bipolar; Min Supply Voltage: 2V; Max Supply Voltage: 5.5V; Supply Type: Single; Conversion Rate: 0.86KS/s; Number of Inputs: 4; Integral Nonlinearity (INL): 1LSB; Power Dissipation: 900uW; Nominal Supply Current: 150uA; Number of Channels: 2; Supplier: Mouser; Supplier Part Number: 595-ADS1115IDGSR; Manufacturer Part Number: ADS1115IDGSR; RoHS: Yes; Category: Analog to Digital Converters (ADCs); Stock: 5925; Pricing: 1=5.44, 10=4.76, 50=4.76, 100=4.01, 1000=2.88, 10000=2.78 (USD); Case/Package: VSSOP; Pins: 10; Contact Plating: Gold; Min Operating Temperature: -40°C; Max Operating Temperature: 125°C; Package Quantity: 2500; Packaging: Tape and Reel; Number of Converters: 1; Max Supply Voltage (DC): 5.5V; Min Supply Voltage (DC): 2V; Series: -; Length: 3mm; Width: 3mm; Height: 1.07mm; Thickness: 1.02mm; Reach SVHC Compliant: No; Lead Free: Lead Free; RoHS Compliant: Yes; ComponentLink1URL: https://datasheet.ciiva.com/4031/47725463s8438921n7713-4031028.pdf?src-supplier=Arrow+Electronics; ComponentLink1Description: https://datasheet.ciiva.com/4031/47725463s8438921n7713-4031028.pdf?src-supplier=Arrow+Electronics; LCSC Part Number: C37593; Item Type: IC